# Altium schematic sheet ESP_32.SchDoc
size A4; SheetNumber: 2; SheetTotal: 6
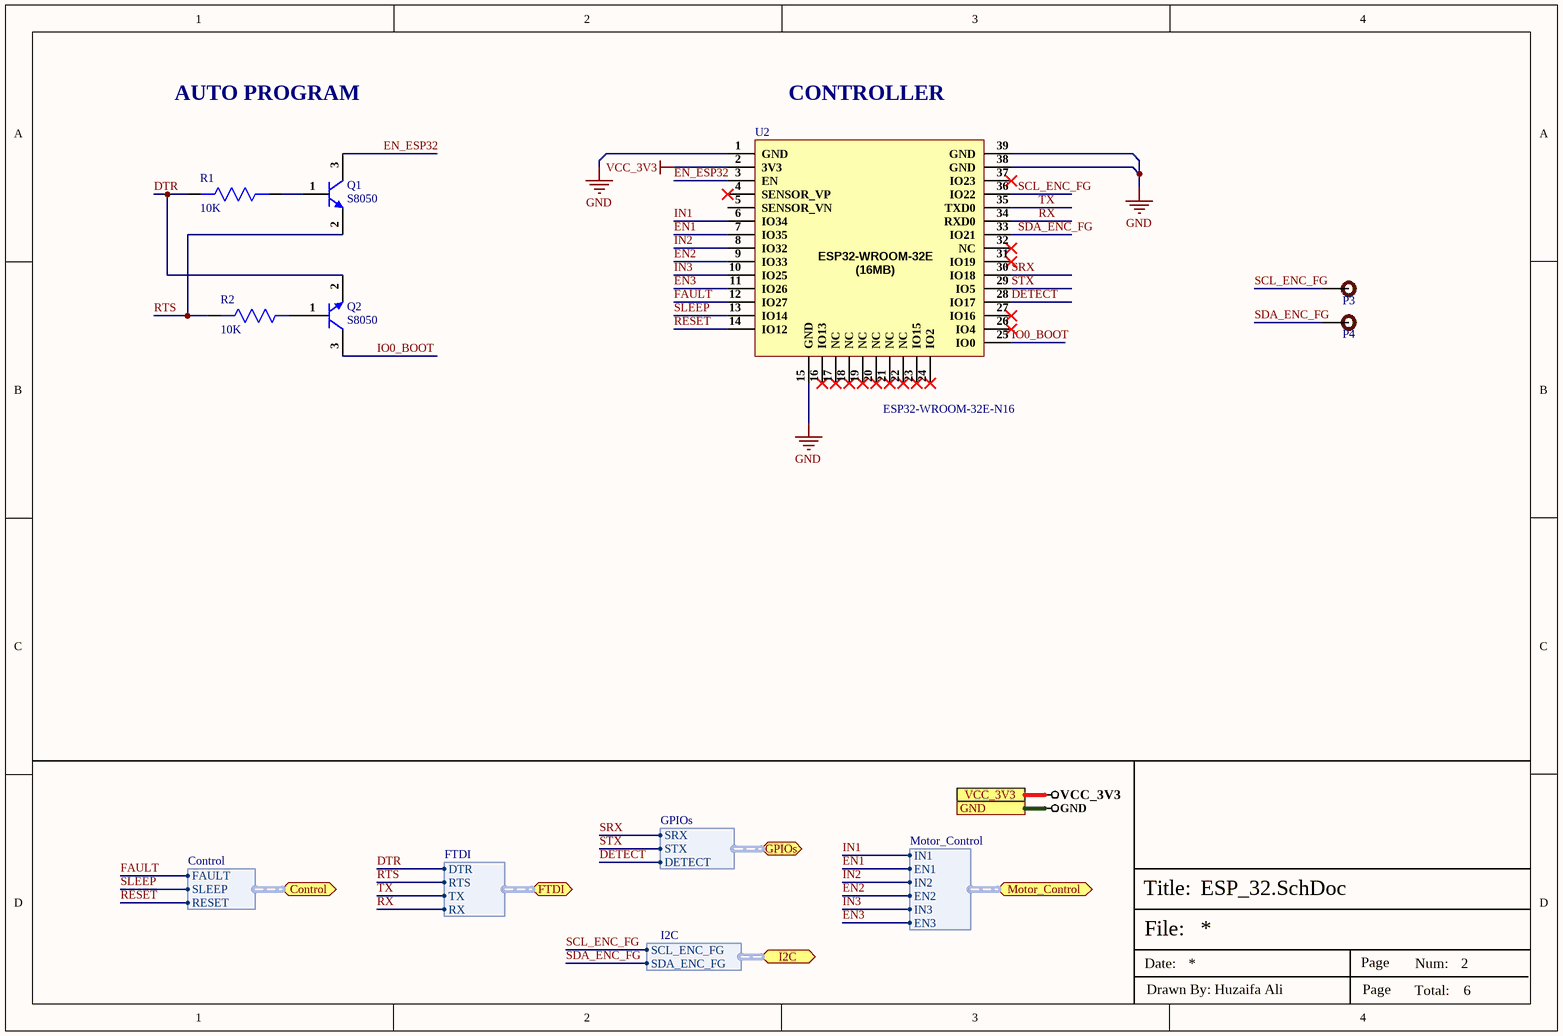
[diagram p0: ESP_32.SchDoc]

## Parts
P3  TEST POINT  [Test-point]  (value not drawn)
P4  TEST POINT  [Test-point]  (value not drawn)
Q1  S8050  [SOT-23]
Q2  S8050  [SOT-23]
R1  10K  [Res-0603]
R2  10K  [Res-0603]
U2  ESP32-WROOM-32E-N16  [38-SMD Module]

## Ports
Control (bidir, harness Control), FTDI (bidir, harness FTDI), GND, GPIOs (bidir, harness GPIOs), I2C (bidir, harness I2C), Motor_Control (bidir, harness Motor_Control), VCC_3V3

## Harnesses
Motor_Control: IN1, EN1, IN2, EN2, IN3, EN3
Control: FAULT, SLEEP, RESET
FTDI: DTR, TX, RX, RTS
I2C: SCL_ENC_FG, SDA_ENC_FG
GPIOs: SRX, STX, DETECT

## Nets
GND: U2.1(GND) U2.15(GND) U2.38(GND) U2.39(GND) ; port GND
VCC_3V3: U2.2(3V3) ; port VCC_3V3
DETECT: U2.28(IO17) ; port GPIOs.DETECT
DTR: Q2.2(E) R1.2 ; port FTDI.DTR
EN1: U2.7(IO35) ; port Motor_Control.EN1
EN2: U2.9(IO33) ; port Motor_Control.EN2
EN3: U2.11(IO26) ; port Motor_Control.EN3
EN_ESP32: Q1.3(C) U2.3(EN)
FAULT: U2.12(IO27) ; port Control.FAULT
IN1: U2.6(IO34) ; port Motor_Control.IN1
IN2: U2.8(IO32) ; port Motor_Control.IN2
IN3: U2.10(IO25) ; port Motor_Control.IN3
IO0_BOOT: Q2.3(C) U2.25(IO0)
RESET: U2.14(IO12) ; port Control.RESET
RTS: Q1.2(E) R2.2 ; port FTDI.RTS
RX: U2.34(RXD0) ; port FTDI.RX
SCL_ENC_FG: P3.1 U2.36(IO22) ; port I2C.SCL_ENC_FG
SDA_ENC_FG: P4.1 U2.33(IO21) ; port I2C.SDA_ENC_FG
SLEEP: U2.13(IO14) ; port Control.SLEEP
SRX: U2.30(IO18) ; port GPIOs.SRX
STX: U2.29(IO5) ; port GPIOs.STX
TX: U2.35(TXD0) ; port FTDI.TX
NetQ1_1: Q1.1(B) R1.1
NetQ2_1: Q2.1(B) R2.1

Not connected (* = marked no-connect by the designer): U2 4(SENSOR_VP)* 5(SENSOR_VN) 16(IO13)* 17(NC)* 18(NC)* 19(NC)* 20(NC)* 21(NC)* 22(NC)* 23(IO15)* 24(IO2)* 26(IO4)* 27(IO16)* 31(IO19)* 32(NC)* 37(IO23)*

## Notes on the sheet
- AUTO PROGRAM
- (near U2) CONTROLLER
- File:
- Title:
- Date:
- Page
- Num:
- Total:
- Drawn By: Huzaifa Ali
- (in symbol ESP32-WROOM-32E-N16) ESP32-WROOM-32E (16MB) /

## Library data of the parts
P3 P4 = TEST POINT: Test Point ON
Q1 Q2 = S8050: Trans Gp Bjt NPN 25V 1.5A 300MW 3-PIN SOT-23 T/r; Manufacturer: Comchip; Manufacturer Part Number: SS8050-G; Collector Emitter Voltage (VCEO): 400mV; Transition Frequency: 100MHz; Supplier 1: Arrow Electronics; RoHS: Yes; Stock 1: 2514; Pricing 1: 1=0.26480, 10=0.19960, 25=0.19760, 50=0.19590, 100=0.09990, 250=0.09890, 500=0.07670, 1000=0.05180 (USD); Mount: Surface Mount; Case/Package: TO-236-3; Packaging: Tape and Reel; Max Power Dissipation: 300mW; Max Collector Current: 1.5A; Collector Emitter Breakdown Voltage: 25V; Max Breakdown Voltage: 25V; ComponentLink1URL: http://www.comchiptech.com/admin/files/product/SS8050-G RevA181526.pdf?src-supplier=Digi-Key; ComponentLink1Description: http://www.comchiptech.com/admin/files/product/SS8050-G RevA181526.pdf?src-supplier=Digi-Key; ComponentLink2URL: http://www.comchiptech.com/cms/UserFiles/SS8050-G%20RevA181526.pdf?src-supplier=Digi-Key; ComponentLink2Description: http://www.comchiptech.com/cms/UserFiles/SS8050-G%20RevA181526.pdf?src-supplier=Digi-Key; Supplier Part Number 1: SS8050-G; LCSC Part Number: C105433
R1 R2 = AC0603JR-0710KL: RES SMD 10K OHM 5% 1/10W 0603; Manufacturer: Yageo; Voltage Rating: 50V; Resistance: 10kR; Power Rating: 100mW; Temperature Coefficient: 100ppm/°C; Supplier 1: Future Electronics; Manufacturer Part Number: AC0603JR-0710KL; RoHS: Yes; Category: Chip SMD Resistors; Stock 1: 1533000; Pricing 1: 5000=0.00540 (USD); Case/Package: 0603; Case Code (Imperial): 0603; Case Code (Metric): 1608; Size Code: 0603; Min Operating Temperature: -55°C; Max Operating Temperature: 155°C; Packaging: Tape and Reel; Tolerance: 5%; Package Quantity: 1; Resistor Type: Thick Film; Termination: SMD/SMT; Number of Terminations: 2; Max Power Dissipation: 100mW; Features: Moisture Resistant,Automotive AEC-Q200,Anti-Sulfur; Series: AC; Construction: Rectangular; Length: 0.063inch; Width: 0.031inch; Height: 0.022inch; Depth: 0.8mm; Military Standard: Not; Lead Free: Lead Free; RoHS Compliant: Yes; ComponentLink1URL: https://datasheet.ciiva.com/5562/pyu-ac-51-rohs-l-2-5562553.pdf?src-supplier=Mouser; ComponentLink1Description: https://datasheet.ciiva.com/5562/pyu-ac-51-rohs-l-2-5562553.pdf?src-supplier=Mouser; Supplier Part Number 1: 1029044; LCSC Part Number: C140867
U2 = ESP32-WROOM-32E-N16: SMD38,18x25.5x3.1 WiFi Modules ROHS; Manufacturer: Espressif Systems; Item Type: IC; Supplier 1: Digi-Key; Manufacturer Part Number: ESP32-WROOM-32E-N16; RoHS: No; Category: Uncategorized; Stock 1: 16240; Pricing 1: 1=3.60000 (USD); LCSC Part Number: C701343; Supplier Part Number 1: 1965-ESP32-WROOM-32E-N16CT-ND